# Altium schematic sheet channels_0.schdoc
size 400 x 299 mm; Device: default420x319; Symbol: default420x319; Name: default420x319; Size: "User"; Id: /; File: channels_0; Sheet: /
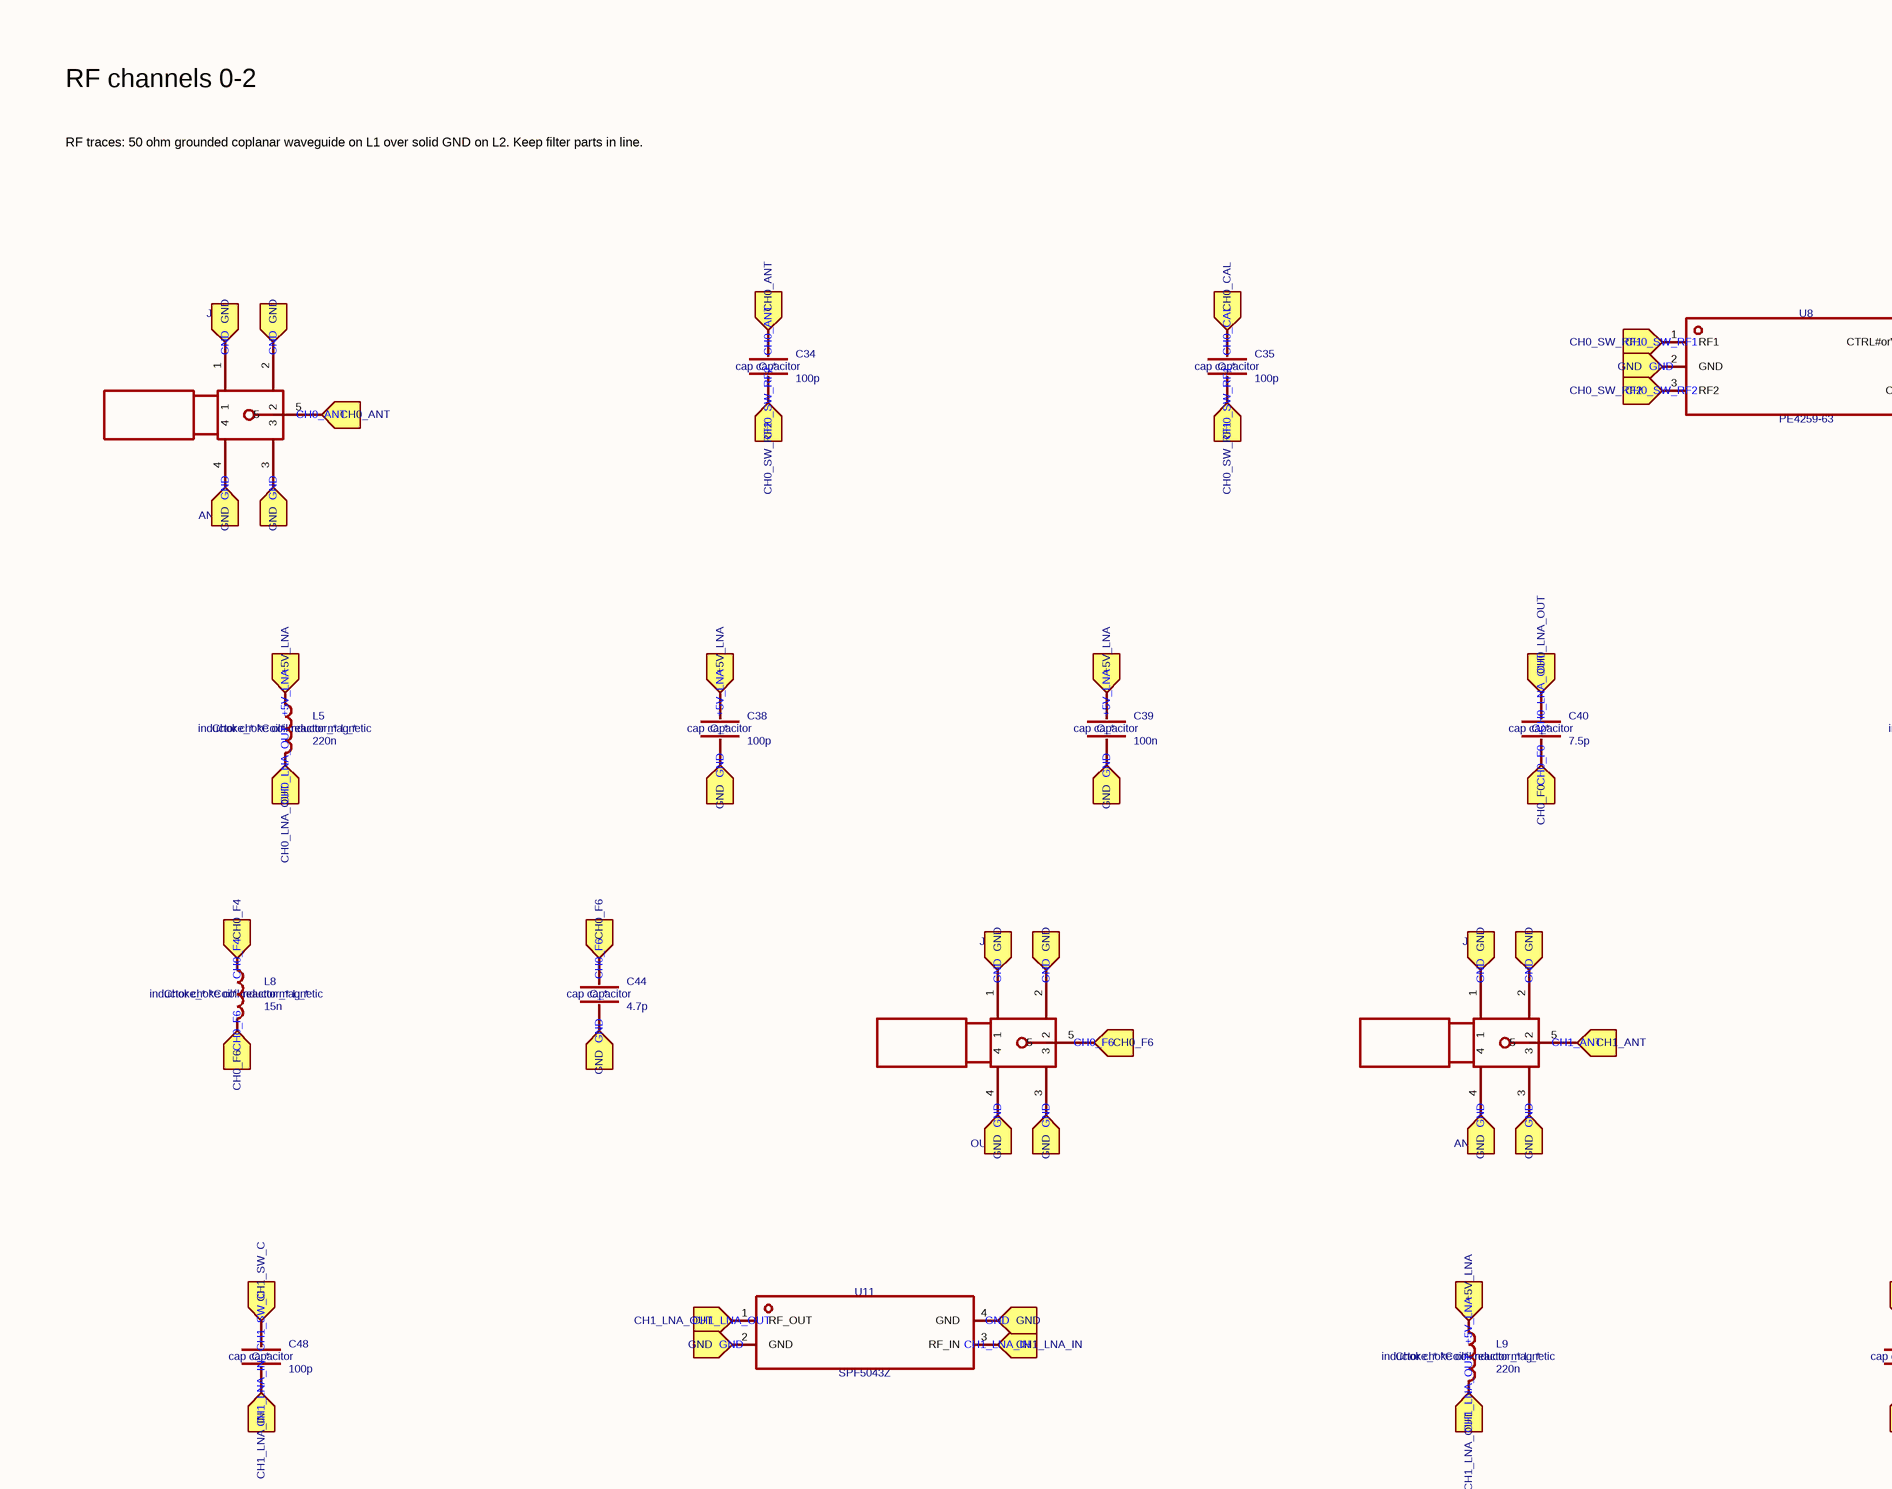
[diagram p0: channels_0.schdoc, top left]
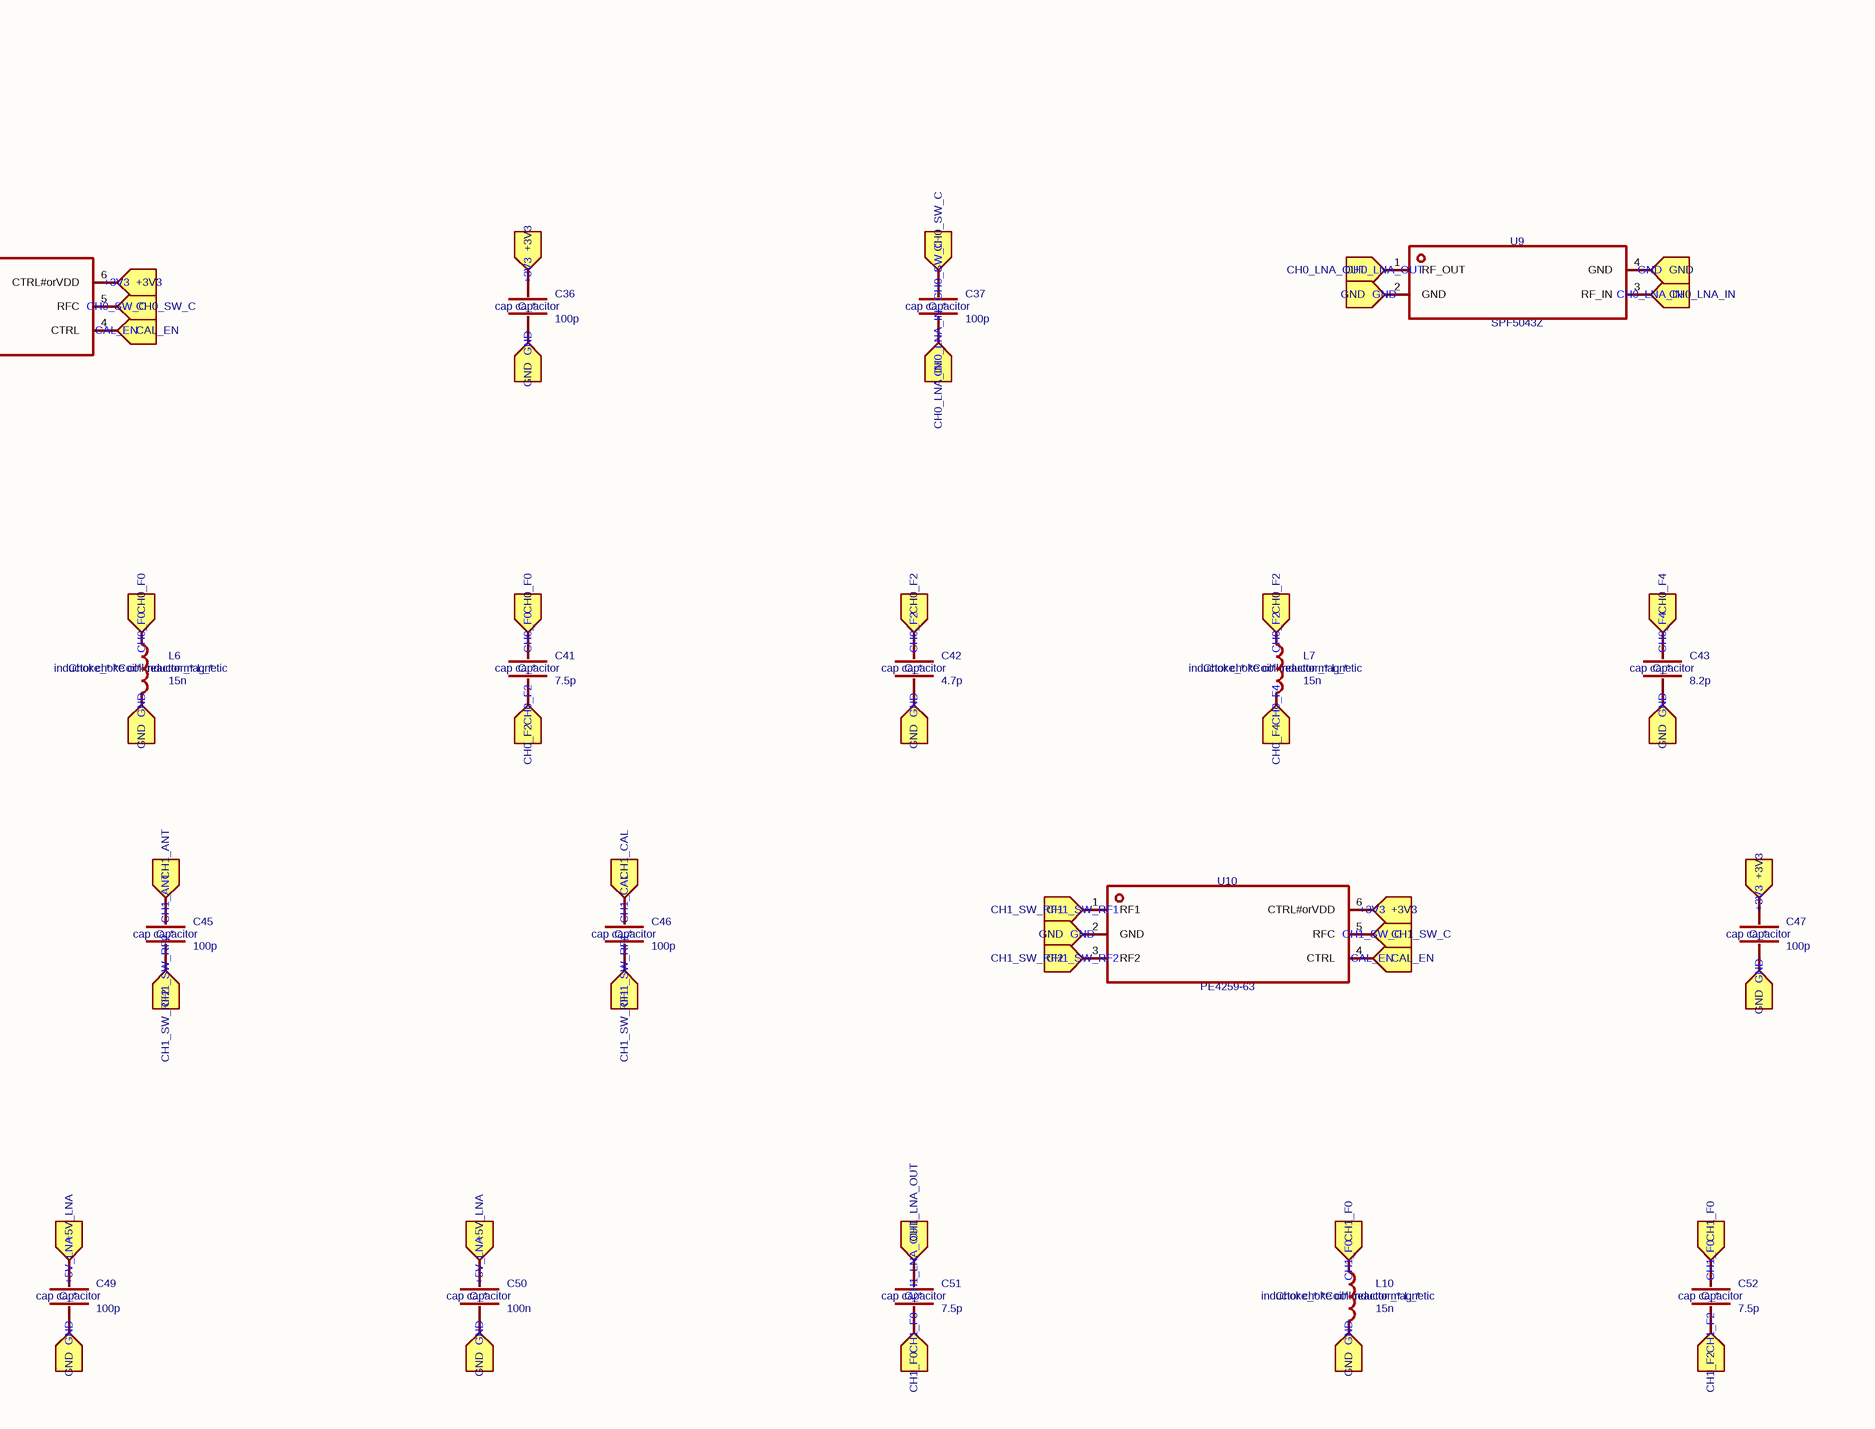
[diagram p1: channels_0.schdoc, top right]
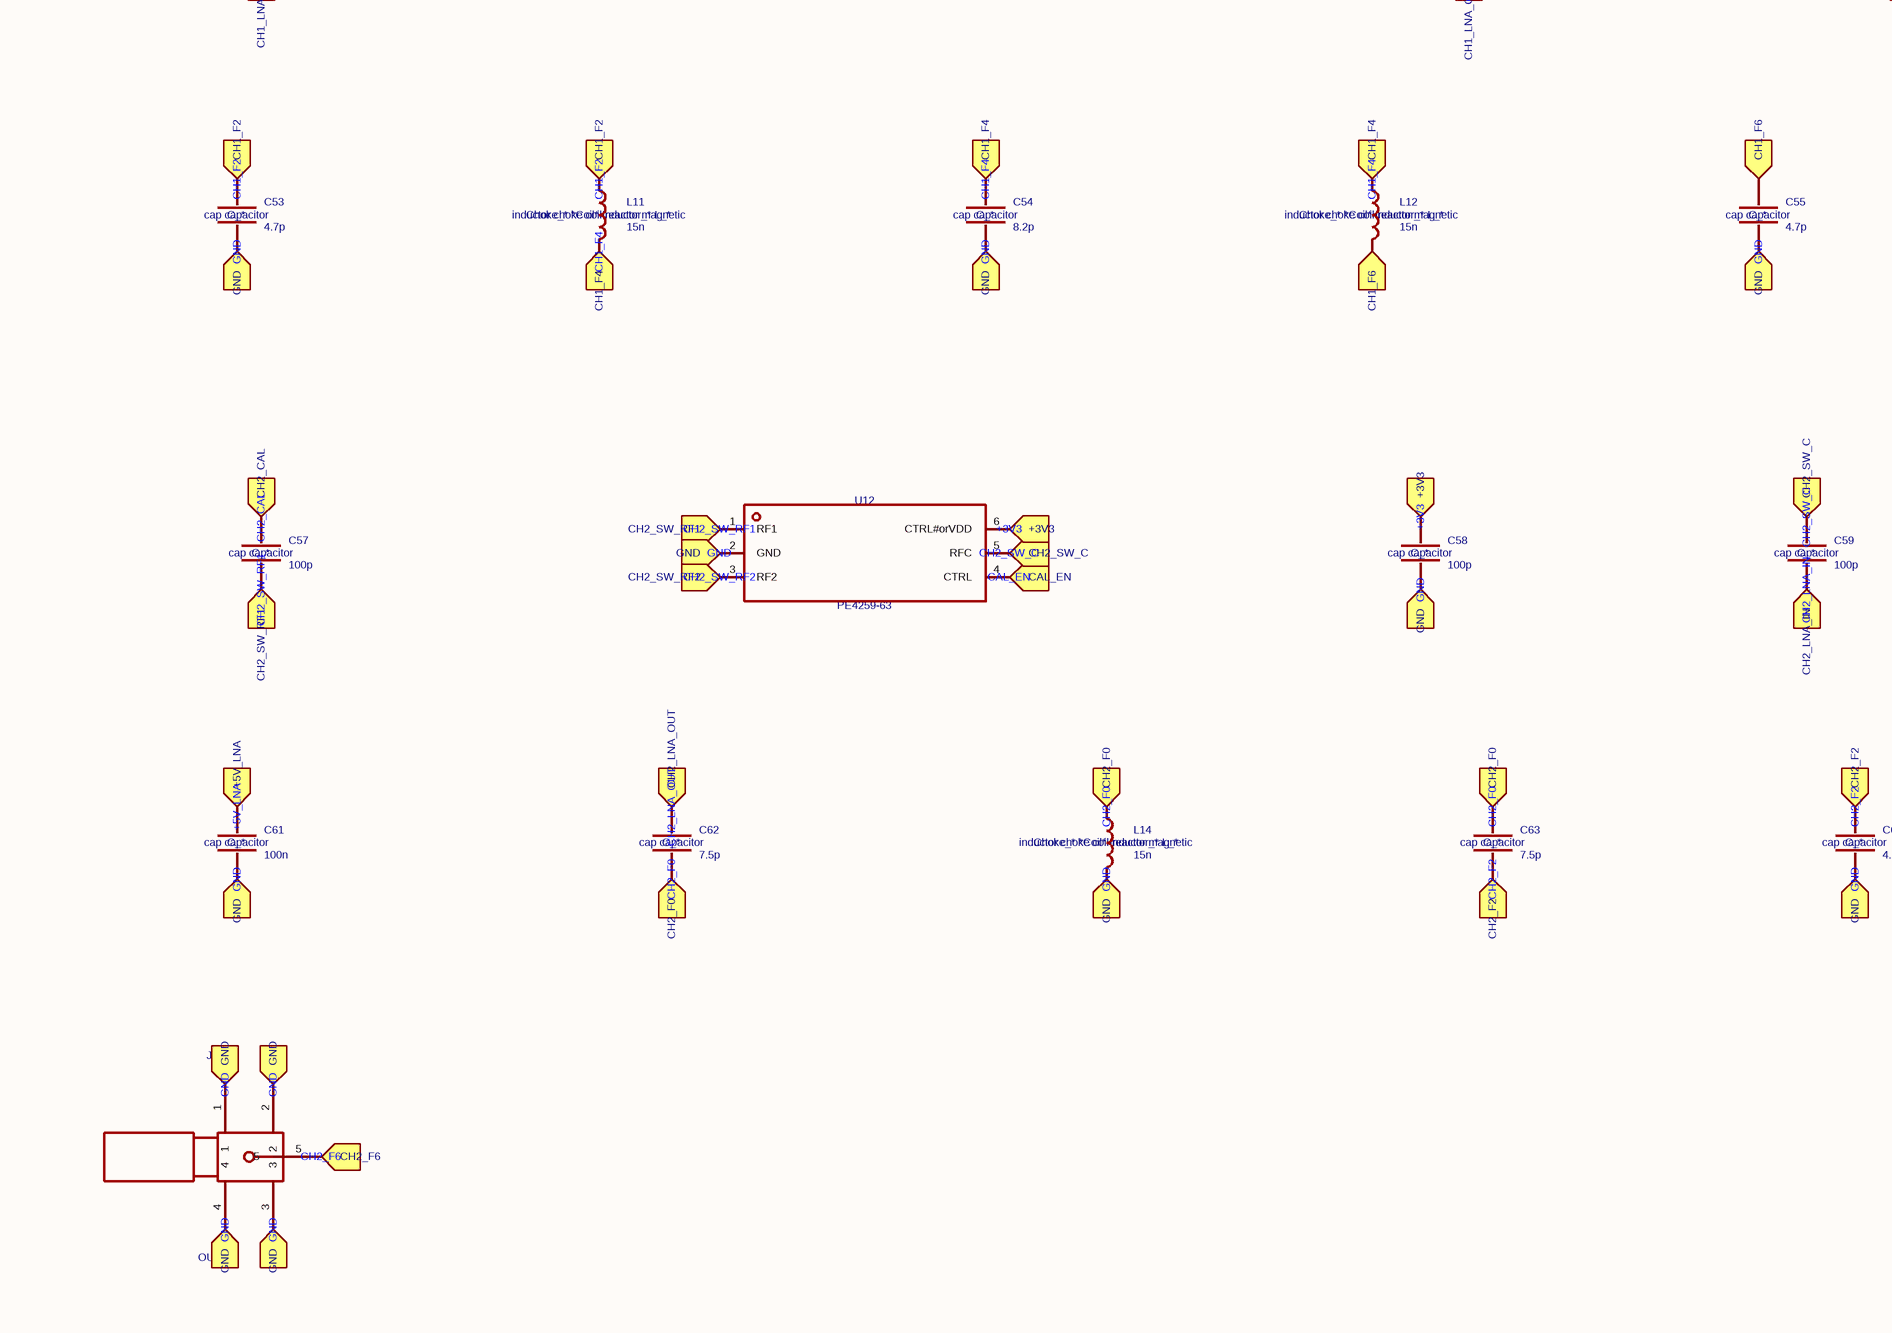
[diagram p2: channels_0.schdoc, bottom left]
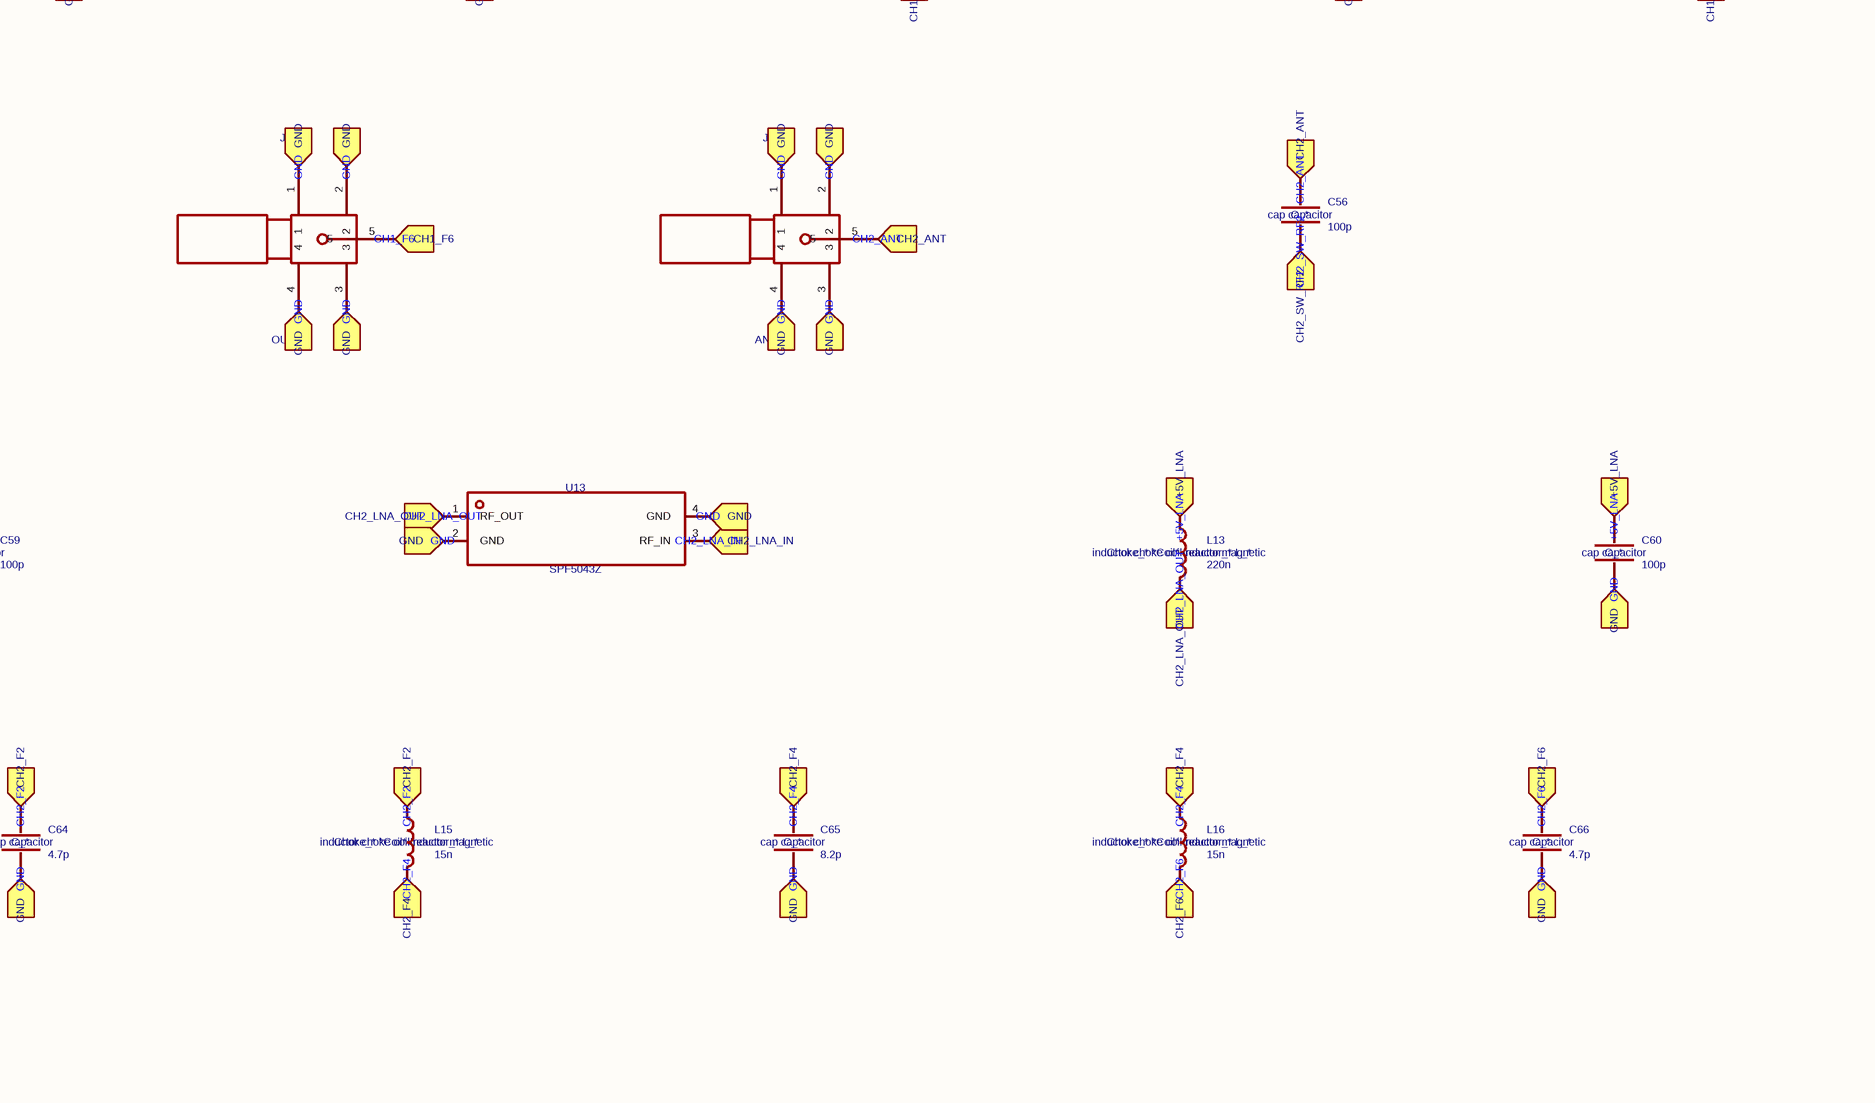
[diagram p3: channels_0.schdoc, bottom right]

## Parts
C34  value 100p  ki_keywords: cap capacitor  ki_fp_filters: C_*  [Capacitor_SMD:C_0402_1005Metric]  (hidden comment: Device_C)
C35  value 100p  ki_keywords: cap capacitor  ki_fp_filters: C_*  [Capacitor_SMD:C_0402_1005Metric]  (hidden comment: Device_C)
C36  value 100p  ki_keywords: cap capacitor  ki_fp_filters: C_*  [Capacitor_SMD:C_0402_1005Metric]  (hidden comment: Device_C)
C37  value 100p  ki_keywords: cap capacitor  ki_fp_filters: C_*  [Capacitor_SMD:C_0402_1005Metric]  (hidden comment: Device_C)
C38  value 100p  ki_keywords: cap capacitor  ki_fp_filters: C_*  [Capacitor_SMD:C_0402_1005Metric]  (hidden comment: Device_C)
C39  value 100n  ki_keywords: cap capacitor  ki_fp_filters: C_*  [Capacitor_SMD:C_0402_1005Metric]  (hidden comment: Device_C)
C40  value 7.5p  ki_keywords: cap capacitor  ki_fp_filters: C_*  [Capacitor_SMD:C_0402_1005Metric]  (hidden comment: Device_C)
C41  value 7.5p  ki_keywords: cap capacitor  ki_fp_filters: C_*  [Capacitor_SMD:C_0402_1005Metric]  (hidden comment: Device_C)
C42  value 4.7p  ki_keywords: cap capacitor  ki_fp_filters: C_*  [Capacitor_SMD:C_0402_1005Metric]  (hidden comment: Device_C)
C43  value 8.2p  ki_keywords: cap capacitor  ki_fp_filters: C_*  [Capacitor_SMD:C_0402_1005Metric]  (hidden comment: Device_C)
C44  value 4.7p  ki_keywords: cap capacitor  ki_fp_filters: C_*  [Capacitor_SMD:C_0402_1005Metric]  (hidden comment: Device_C)
C45  value 100p  ki_keywords: cap capacitor  ki_fp_filters: C_*  [Capacitor_SMD:C_0402_1005Metric]  (hidden comment: Device_C)
C46  value 100p  ki_keywords: cap capacitor  ki_fp_filters: C_*  [Capacitor_SMD:C_0402_1005Metric]  (hidden comment: Device_C)
C47  value 100p  ki_keywords: cap capacitor  ki_fp_filters: C_*  [Capacitor_SMD:C_0402_1005Metric]  (hidden comment: Device_C)
C48  value 100p  ki_keywords: cap capacitor  ki_fp_filters: C_*  [Capacitor_SMD:C_0402_1005Metric]  (hidden comment: Device_C)
C49  value 100p  ki_keywords: cap capacitor  ki_fp_filters: C_*  [Capacitor_SMD:C_0402_1005Metric]  (hidden comment: Device_C)
C50  value 100n  ki_keywords: cap capacitor  ki_fp_filters: C_*  [Capacitor_SMD:C_0402_1005Metric]  (hidden comment: Device_C)
C51  value 7.5p  ki_keywords: cap capacitor  ki_fp_filters: C_*  [Capacitor_SMD:C_0402_1005Metric]  (hidden comment: Device_C)
C52  value 7.5p  ki_keywords: cap capacitor  ki_fp_filters: C_*  [Capacitor_SMD:C_0402_1005Metric]  (hidden comment: Device_C)
C53  value 4.7p  ki_keywords: cap capacitor  ki_fp_filters: C_*  [Capacitor_SMD:C_0402_1005Metric]  (hidden comment: Device_C)
C54  value 8.2p  ki_keywords: cap capacitor  ki_fp_filters: C_*  [Capacitor_SMD:C_0402_1005Metric]  (hidden comment: Device_C)
C55  value 4.7p  ki_keywords: cap capacitor  ki_fp_filters: C_*  [Capacitor_SMD:C_0402_1005Metric]  (hidden comment: Device_C)
C56  value 100p  ki_keywords: cap capacitor  ki_fp_filters: C_*  [Capacitor_SMD:C_0402_1005Metric]  (hidden comment: Device_C)
C57  value 100p  ki_keywords: cap capacitor  ki_fp_filters: C_*  [Capacitor_SMD:C_0402_1005Metric]  (hidden comment: Device_C)
C58  value 100p  ki_keywords: cap capacitor  ki_fp_filters: C_*  [Capacitor_SMD:C_0402_1005Metric]  (hidden comment: Device_C)
C59  value 100p  ki_keywords: cap capacitor  ki_fp_filters: C_*  [Capacitor_SMD:C_0402_1005Metric]  (hidden comment: Device_C)
C60  value 100p  ki_keywords: cap capacitor  ki_fp_filters: C_*  [Capacitor_SMD:C_0402_1005Metric]  (hidden comment: Device_C)
C61  value 100n  ki_keywords: cap capacitor  ki_fp_filters: C_*  [Capacitor_SMD:C_0402_1005Metric]  (hidden comment: Device_C)
C62  value 7.5p  ki_keywords: cap capacitor  ki_fp_filters: C_*  [Capacitor_SMD:C_0402_1005Metric]  (hidden comment: Device_C)
C63  value 7.5p  ki_keywords: cap capacitor  ki_fp_filters: C_*  [Capacitor_SMD:C_0402_1005Metric]  (hidden comment: Device_C)
C64  value 4.7p  ki_keywords: cap capacitor  ki_fp_filters: C_*  [Capacitor_SMD:C_0402_1005Metric]  (hidden comment: Device_C)
C65  value 8.2p  ki_keywords: cap capacitor  ki_fp_filters: C_*  [Capacitor_SMD:C_0402_1005Metric]  (hidden comment: Device_C)
C66  value 4.7p  ki_keywords: cap capacitor  ki_fp_filters: C_*  [Capacitor_SMD:C_0402_1005Metric]  (hidden comment: Device_C)
J3  value ANT0  [prc:SMA-TH_BWSMA-KE-Z001]  (hidden comment: prc_BWSMA-KE-Z001)
J4  value OUT0  [prc:SMA-TH_BWSMA-KE-Z001]  (hidden comment: prc_BWSMA-KE-Z001)
J5  value ANT1  [prc:SMA-TH_BWSMA-KE-Z001]  (hidden comment: prc_BWSMA-KE-Z001)
J6  value OUT1  [prc:SMA-TH_BWSMA-KE-Z001]  (hidden comment: prc_BWSMA-KE-Z001)
J7  value ANT2  [prc:SMA-TH_BWSMA-KE-Z001]  (hidden comment: prc_BWSMA-KE-Z001)
J8  value OUT2  [prc:SMA-TH_BWSMA-KE-Z001]  (hidden comment: prc_BWSMA-KE-Z001)
L5  value 220n  ki_keywords: inductor choke coil reactor magnetic  ki_fp_filters: Choke_* *Coil* Inductor_* L_*  [Inductor_SMD:L_0603_1608Metric]  (hidden comment: Device_L)
L6  value 15n  ki_keywords: inductor choke coil reactor magnetic  ki_fp_filters: Choke_* *Coil* Inductor_* L_*  [Inductor_SMD:L_0402_1005Metric]  (hidden comment: Device_L)
L7  value 15n  ki_keywords: inductor choke coil reactor magnetic  ki_fp_filters: Choke_* *Coil* Inductor_* L_*  [Inductor_SMD:L_0402_1005Metric]  (hidden comment: Device_L)
L8  value 15n  ki_keywords: inductor choke coil reactor magnetic  ki_fp_filters: Choke_* *Coil* Inductor_* L_*  [Inductor_SMD:L_0402_1005Metric]  (hidden comment: Device_L)
L9  value 220n  ki_keywords: inductor choke coil reactor magnetic  ki_fp_filters: Choke_* *Coil* Inductor_* L_*  [Inductor_SMD:L_0603_1608Metric]  (hidden comment: Device_L)
L10  value 15n  ki_keywords: inductor choke coil reactor magnetic  ki_fp_filters: Choke_* *Coil* Inductor_* L_*  [Inductor_SMD:L_0402_1005Metric]  (hidden comment: Device_L)
L11  value 15n  ki_keywords: inductor choke coil reactor magnetic  ki_fp_filters: Choke_* *Coil* Inductor_* L_*  [Inductor_SMD:L_0402_1005Metric]  (hidden comment: Device_L)
L12  value 15n  ki_keywords: inductor choke coil reactor magnetic  ki_fp_filters: Choke_* *Coil* Inductor_* L_*  [Inductor_SMD:L_0402_1005Metric]  (hidden comment: Device_L)
L13  value 220n  ki_keywords: inductor choke coil reactor magnetic  ki_fp_filters: Choke_* *Coil* Inductor_* L_*  [Inductor_SMD:L_0603_1608Metric]  (hidden comment: Device_L)
L14  value 15n  ki_keywords: inductor choke coil reactor magnetic  ki_fp_filters: Choke_* *Coil* Inductor_* L_*  [Inductor_SMD:L_0402_1005Metric]  (hidden comment: Device_L)
L15  value 15n  ki_keywords: inductor choke coil reactor magnetic  ki_fp_filters: Choke_* *Coil* Inductor_* L_*  [Inductor_SMD:L_0402_1005Metric]  (hidden comment: Device_L)
L16  value 15n  ki_keywords: inductor choke coil reactor magnetic  ki_fp_filters: Choke_* *Coil* Inductor_* L_*  [Inductor_SMD:L_0402_1005Metric]  (hidden comment: Device_L)
U8  value PE4259-63  [prc:SC-70-6_L2.2-W1.3-P0.65-LS2.1-BL]  (hidden comment: prc_PE4259-63)
U9  value SPF5043Z  [prc:SOT343_L2.0-W1.3-P1.30-LS2.1-BL]  (hidden comment: prc_SPF5043Z)
U10  value PE4259-63  [prc:SC-70-6_L2.2-W1.3-P0.65-LS2.1-BL]  (hidden comment: prc_PE4259-63)
U11  value SPF5043Z  [prc:SOT343_L2.0-W1.3-P1.30-LS2.1-BL]  (hidden comment: prc_SPF5043Z)
U12  value PE4259-63  [prc:SC-70-6_L2.2-W1.3-P0.65-LS2.1-BL]  (hidden comment: prc_PE4259-63)
U13  value SPF5043Z  [prc:SOT343_L2.0-W1.3-P1.30-LS2.1-BL]  (hidden comment: prc_SPF5043Z)

## Ports
+3V3 (in), +5V_LNA (in), CAL_EN (in), CH0_ANT (in), CH0_CAL (in), CH0_F0 (in), CH0_F2 (in), CH0_F4 (in), CH0_F6 (in), CH0_LNA_IN (in), CH0_LNA_OUT (in), CH0_SW_C (in), CH0_SW_RF1 (in), CH0_SW_RF2 (in), CH1_ANT (in), CH1_CAL (in), CH1_F0 (in), CH1_F2 (in), CH1_F4 (in), CH1_F6 (in), CH1_LNA_IN (in), CH1_LNA_OUT (in), CH1_SW_C (in), CH1_SW_RF1 (in), CH1_SW_RF2 (in), CH2_ANT (in), CH2_CAL (in), CH2_F0 (in), CH2_F2 (in), CH2_F4 (in), CH2_F6 (in), CH2_LNA_IN (in), CH2_LNA_OUT (in), CH2_SW_C (in), CH2_SW_RF1 (in), CH2_SW_RF2 (in), GND (in)

## Nets
+3V3: C36.1 C47.1 C58.1 U8.6(CTRL#orVDD) U10.6(CTRL#orVDD) U12.6(CTRL#orVDD) ; port +3V3
+5V_LNA: C38.1 C39.1 C49.1 C50.1 C60.1 C61.1 L5.1 L9.1 L13.1 ; port +5V_LNA
CAL_EN: U8.4(CTRL) U10.4(CTRL) U12.4(CTRL) ; port CAL_EN
CH0_ANT: C34.1 J3.5 ; port CH0_ANT
CH0_CAL: C35.1 ; port CH0_CAL
CH0_F0: C40.2 C41.1 L6.1 ; port CH0_F0
CH0_F2: C41.2 C42.1 L7.1 ; port CH0_F2
CH0_F4: C43.1 L7.2 L8.1 ; port CH0_F4
CH0_F6: C44.1 J4.5 L8.2 ; port CH0_F6
CH0_LNA_IN: C37.2 U9.3(RF_IN) ; port CH0_LNA_IN
CH0_LNA_OUT: C40.1 L5.2 U9.1(RF_OUT) ; port CH0_LNA_OUT
CH0_SW_C: C37.1 U8.5(RFC) ; port CH0_SW_C
CH0_SW_RF1: C35.2 U8.1(RF1) ; port CH0_SW_RF1
CH0_SW_RF2: C34.2 U8.3(RF2) ; port CH0_SW_RF2
CH1_ANT: C45.1 J5.5 ; port CH1_ANT
CH1_CAL: C46.1 ; port CH1_CAL
CH1_F0: C51.2 C52.1 L10.1 ; port CH1_F0
CH1_F2: C52.2 C53.1 L11.1 ; port CH1_F2
CH1_F4: C54.1 L11.2 L12.1 ; port CH1_F4
CH1_F6: C55.1 J6.5 L12.2 ; port CH1_F6
CH1_LNA_IN: C48.2 U11.3(RF_IN) ; port CH1_LNA_IN
CH1_LNA_OUT: C51.1 L9.2 U11.1(RF_OUT) ; port CH1_LNA_OUT
CH1_SW_C: C48.1 U10.5(RFC) ; port CH1_SW_C
CH1_SW_RF1: C46.2 U10.1(RF1) ; port CH1_SW_RF1
CH1_SW_RF2: C45.2 U10.3(RF2) ; port CH1_SW_RF2
CH2_ANT: C56.1 J7.5 ; port CH2_ANT
CH2_CAL: C57.1 ; port CH2_CAL
CH2_F0: C62.2 C63.1 L14.1 ; port CH2_F0
CH2_F2: C63.2 C64.1 L15.1 ; port CH2_F2
CH2_F4: C65.1 L15.2 L16.1 ; port CH2_F4
CH2_F6: C66.1 J8.5 L16.2 ; port CH2_F6
CH2_LNA_IN: C59.2 U13.3(RF_IN) ; port CH2_LNA_IN
CH2_LNA_OUT: C62.1 L13.2 U13.1(RF_OUT) ; port CH2_LNA_OUT
CH2_SW_C: C59.1 U12.5(RFC) ; port CH2_SW_C
CH2_SW_RF1: C57.2 U12.1(RF1) ; port CH2_SW_RF1
CH2_SW_RF2: C56.2 U12.3(RF2) ; port CH2_SW_RF2
GND: C36.2 C38.2 C39.2 C42.2 C43.2 C44.2 C47.2 C49.2 C50.2 C53.2 C54.2 C55.2 C58.2 C60.2 C61.2 C64.2 C65.2 C66.2 J3.1 J3.2 J3.3 J3.4 J4.1 J4.2 J4.3 J4.4 J5.1 J5.2 J5.3 J5.4 J6.1 J6.2 J6.3 J6.4 J7.1 J7.2 J7.3 J7.4 J8.1 J8.2 J8.3 J8.4 L6.2 L10.2 L14.2 U8.2(GND) U9.2(GND) U9.4(GND) U10.2(GND) U11.2(GND) U11.4(GND) U12.2(GND) U13.2(GND) U13.4(GND) ; port GND

## Notes on the sheet
- RF channels 0-2
- RF traces: 50 ohm grounded coplanar waveguide on L1 over solid GND on L2. Keep filter parts in line.
- 1
- 2
- 3
- 4
- 5
- 6
- 7
- 8
- A
- B
- C
- D
- E
- F
- Size:"User"
- Title:
- File:channels_0
- Sheet:/
- Date:
- Rev:
- Id:/

## Library data of the parts
C34 = Device_C: UniqueId: 553def7d7947fca6; KiLib_Generator: SMD_2terminal_chip_molded; AddInBom: yes; Device: Device_C; Symbol: Device_C; FootprintName: Capacitor_SMD:C_0402_1005Metric
C35 = Device_C: UniqueId: 2b4e6e580c7acde0; KiLib_Generator: SMD_2terminal_chip_molded; AddInBom: yes; Device: Device_C; Symbol: Device_C; FootprintName: Capacitor_SMD:C_0402_1005Metric
C36 = Device_C: UniqueId: 3db1f6a400993974; KiLib_Generator: SMD_2terminal_chip_molded; AddInBom: yes; Device: Device_C; Symbol: Device_C; FootprintName: Capacitor_SMD:C_0402_1005Metric
C37 = Device_C: UniqueId: ff078052695da6b6; KiLib_Generator: SMD_2terminal_chip_molded; AddInBom: yes; Device: Device_C; Symbol: Device_C; FootprintName: Capacitor_SMD:C_0402_1005Metric
C38 = Device_C: UniqueId: 6827ca7a6bd67e26; KiLib_Generator: SMD_2terminal_chip_molded; AddInBom: yes; Device: Device_C; Symbol: Device_C; FootprintName: Capacitor_SMD:C_0402_1005Metric
C39 = Device_C: UniqueId: 54d3d224326b3f8f; KiLib_Generator: SMD_2terminal_chip_molded; AddInBom: yes; Device: Device_C; Symbol: Device_C; LCSC: C1525; FootprintName: Capacitor_SMD:C_0402_1005Metric
C40 = Device_C: UniqueId: 12af2948e5a85261; KiLib_Generator: SMD_2terminal_chip_molded; AddInBom: yes; Device: Device_C; Symbol: Device_C; FootprintName: Capacitor_SMD:C_0402_1005Metric
C41 = Device_C: UniqueId: c9655d0faea7d93e; KiLib_Generator: SMD_2terminal_chip_molded; AddInBom: yes; Device: Device_C; Symbol: Device_C; FootprintName: Capacitor_SMD:C_0402_1005Metric
C42 = Device_C: UniqueId: d39ee3bf0fadc3c1; KiLib_Generator: SMD_2terminal_chip_molded; AddInBom: yes; Device: Device_C; Symbol: Device_C; FootprintName: Capacitor_SMD:C_0402_1005Metric
C43 = Device_C: UniqueId: ad7e9e1612356ddb; KiLib_Generator: SMD_2terminal_chip_molded; AddInBom: yes; Device: Device_C; Symbol: Device_C; FootprintName: Capacitor_SMD:C_0402_1005Metric
C44 = Device_C: UniqueId: 49133e3f49d3504d; KiLib_Generator: SMD_2terminal_chip_molded; AddInBom: yes; Device: Device_C; Symbol: Device_C; FootprintName: Capacitor_SMD:C_0402_1005Metric
C45 = Device_C: UniqueId: 9dabde1b2911a551; KiLib_Generator: SMD_2terminal_chip_molded; AddInBom: yes; Device: Device_C; Symbol: Device_C; FootprintName: Capacitor_SMD:C_0402_1005Metric
C46 = Device_C: UniqueId: df918f74c5ced612; KiLib_Generator: SMD_2terminal_chip_molded; AddInBom: yes; Device: Device_C; Symbol: Device_C; FootprintName: Capacitor_SMD:C_0402_1005Metric
C47 = Device_C: UniqueId: 64621f1995cfd5bc; KiLib_Generator: SMD_2terminal_chip_molded; AddInBom: yes; Device: Device_C; Symbol: Device_C; FootprintName: Capacitor_SMD:C_0402_1005Metric
C48 = Device_C: UniqueId: 808ebf677d8d6d64; KiLib_Generator: SMD_2terminal_chip_molded; AddInBom: yes; Device: Device_C; Symbol: Device_C; FootprintName: Capacitor_SMD:C_0402_1005Metric
C49 = Device_C: UniqueId: 91fd74edebd22ea1; KiLib_Generator: SMD_2terminal_chip_molded; AddInBom: yes; Device: Device_C; Symbol: Device_C; FootprintName: Capacitor_SMD:C_0402_1005Metric
C50 = Device_C: UniqueId: 32f6df7045cd6eaa; KiLib_Generator: SMD_2terminal_chip_molded; AddInBom: yes; Device: Device_C; Symbol: Device_C; LCSC: C1525; FootprintName: Capacitor_SMD:C_0402_1005Metric
C51 = Device_C: UniqueId: d35436b77a732af0; KiLib_Generator: SMD_2terminal_chip_molded; AddInBom: yes; Device: Device_C; Symbol: Device_C; FootprintName: Capacitor_SMD:C_0402_1005Metric
C52 = Device_C: UniqueId: 35d858017be1d91e; KiLib_Generator: SMD_2terminal_chip_molded; AddInBom: yes; Device: Device_C; Symbol: Device_C; FootprintName: Capacitor_SMD:C_0402_1005Metric
C53 = Device_C: UniqueId: af7046427a4bfdfb; KiLib_Generator: SMD_2terminal_chip_molded; AddInBom: yes; Device: Device_C; Symbol: Device_C; FootprintName: Capacitor_SMD:C_0402_1005Metric
C54 = Device_C: UniqueId: 65328433fb04ddb7; KiLib_Generator: SMD_2terminal_chip_molded; AddInBom: yes; Device: Device_C; Symbol: Device_C; FootprintName: Capacitor_SMD:C_0402_1005Metric
C55 = Device_C: UniqueId: 82ba1af55b3917e5; KiLib_Generator: SMD_2terminal_chip_molded; AddInBom: yes; Device: Device_C; Symbol: Device_C; FootprintName: Capacitor_SMD:C_0402_1005Metric
C56 = Device_C: UniqueId: a22d741cda083e99; KiLib_Generator: SMD_2terminal_chip_molded; AddInBom: yes; Device: Device_C; Symbol: Device_C; FootprintName: Capacitor_SMD:C_0402_1005Metric
C57 = Device_C: UniqueId: 21dd5459dde3f81c; KiLib_Generator: SMD_2terminal_chip_molded; AddInBom: yes; Device: Device_C; Symbol: Device_C; FootprintName: Capacitor_SMD:C_0402_1005Metric
C58 = Device_C: UniqueId: 6c1fb86984bf7302; KiLib_Generator: SMD_2terminal_chip_molded; AddInBom: yes; Device: Device_C; Symbol: Device_C; FootprintName: Capacitor_SMD:C_0402_1005Metric
C59 = Device_C: UniqueId: 9b91e7356bb9865f; KiLib_Generator: SMD_2terminal_chip_molded; AddInBom: yes; Device: Device_C; Symbol: Device_C; FootprintName: Capacitor_SMD:C_0402_1005Metric
C60 = Device_C: UniqueId: 769677d4f8f56233; KiLib_Generator: SMD_2terminal_chip_molded; AddInBom: yes; Device: Device_C; Symbol: Device_C; FootprintName: Capacitor_SMD:C_0402_1005Metric
C61 = Device_C: UniqueId: 3745dda5a27601a3; KiLib_Generator: SMD_2terminal_chip_molded; AddInBom: yes; Device: Device_C; Symbol: Device_C; LCSC: C1525; FootprintName: Capacitor_SMD:C_0402_1005Metric
C62 = Device_C: UniqueId: 4b556904310d1556; KiLib_Generator: SMD_2terminal_chip_molded; AddInBom: yes; Device: Device_C; Symbol: Device_C; FootprintName: Capacitor_SMD:C_0402_1005Metric
C63 = Device_C: UniqueId: b3cb865a57c4a975; KiLib_Generator: SMD_2terminal_chip_molded; AddInBom: yes; Device: Device_C; Symbol: Device_C; FootprintName: Capacitor_SMD:C_0402_1005Metric
C64 = Device_C: UniqueId: 9944326385f1aa7b; KiLib_Generator: SMD_2terminal_chip_molded; AddInBom: yes; Device: Device_C; Symbol: Device_C; FootprintName: Capacitor_SMD:C_0402_1005Metric
C65 = Device_C: UniqueId: ac9f836745bfd3f0; KiLib_Generator: SMD_2terminal_chip_molded; AddInBom: yes; Device: Device_C; Symbol: Device_C; FootprintName: Capacitor_SMD:C_0402_1005Metric
C66 = Device_C: UniqueId: fb27f7370dbf7a2e; KiLib_Generator: SMD_2terminal_chip_molded; AddInBom: yes; Device: Device_C; Symbol: Device_C; FootprintName: Capacitor_SMD:C_0402_1005Metric
J3 = prc_BWSMA-KE-Z001: Manufacturer: BAT WIRELESS(蝙蝠无线); ki_keywords: RF Connectors / Coaxial Connectors; UniqueId: bd3ee0abdb58119f; AddInBom: yes; Device: prc_BWSMA-KE-Z001; Symbol: prc_BWSMA-KE-Z001; UserDocLink: https://lcsc.com/product-detail/New-Arrivals_BAT-WIRELESS-BWSMA-KE-Z001_C496549.html; LCSC: C496549; MPN: BWSMA-KE-Z001; LCSC Part: C496549; FootprintName: prc:SMA-TH_BWSMA-KE-Z001
J4 = prc_BWSMA-KE-Z001: Manufacturer: BAT WIRELESS(蝙蝠无线); ki_keywords: RF Connectors / Coaxial Connectors; UniqueId: 7aadee231938cadd; AddInBom: yes; Device: prc_BWSMA-KE-Z001; Symbol: prc_BWSMA-KE-Z001; UserDocLink: https://lcsc.com/product-detail/New-Arrivals_BAT-WIRELESS-BWSMA-KE-Z001_C496549.html; LCSC: C496549; MPN: BWSMA-KE-Z001; LCSC Part: C496549; FootprintName: prc:SMA-TH_BWSMA-KE-Z001
J5 = prc_BWSMA-KE-Z001: Manufacturer: BAT WIRELESS(蝙蝠无线); ki_keywords: RF Connectors / Coaxial Connectors; UniqueId: 188f82074eb8ca32; AddInBom: yes; Device: prc_BWSMA-KE-Z001; Symbol: prc_BWSMA-KE-Z001; UserDocLink: https://lcsc.com/product-detail/New-Arrivals_BAT-WIRELESS-BWSMA-KE-Z001_C496549.html; LCSC: C496549; MPN: BWSMA-KE-Z001; LCSC Part: C496549; FootprintName: prc:SMA-TH_BWSMA-KE-Z001
J6 = prc_BWSMA-KE-Z001: Manufacturer: BAT WIRELESS(蝙蝠无线); ki_keywords: RF Connectors / Coaxial Connectors; UniqueId: be1703a8306ee88a; AddInBom: yes; Device: prc_BWSMA-KE-Z001; Symbol: prc_BWSMA-KE-Z001; UserDocLink: https://lcsc.com/product-detail/New-Arrivals_BAT-WIRELESS-BWSMA-KE-Z001_C496549.html; LCSC: C496549; MPN: BWSMA-KE-Z001; LCSC Part: C496549; FootprintName: prc:SMA-TH_BWSMA-KE-Z001
J7 = prc_BWSMA-KE-Z001: Manufacturer: BAT WIRELESS(蝙蝠无线); ki_keywords: RF Connectors / Coaxial Connectors; UniqueId: adeb8d5268617f3b; AddInBom: yes; Device: prc_BWSMA-KE-Z001; Symbol: prc_BWSMA-KE-Z001; UserDocLink: https://lcsc.com/product-detail/New-Arrivals_BAT-WIRELESS-BWSMA-KE-Z001_C496549.html; LCSC: C496549; MPN: BWSMA-KE-Z001; LCSC Part: C496549; FootprintName: prc:SMA-TH_BWSMA-KE-Z001
J8 = prc_BWSMA-KE-Z001: Manufacturer: BAT WIRELESS(蝙蝠无线); ki_keywords: RF Connectors / Coaxial Connectors; UniqueId: 5c2e899d33916bcd; AddInBom: yes; Device: prc_BWSMA-KE-Z001; Symbol: prc_BWSMA-KE-Z001; UserDocLink: https://lcsc.com/product-detail/New-Arrivals_BAT-WIRELESS-BWSMA-KE-Z001_C496549.html; LCSC: C496549; MPN: BWSMA-KE-Z001; LCSC Part: C496549; FootprintName: prc:SMA-TH_BWSMA-KE-Z001
L5 = Device_L: UniqueId: a672ad5603fb0b7d; KiLib_Generator: SMD_2terminal_chip_molded; AddInBom: yes; Device: Device_L; Symbol: Device_L; FootprintName: Inductor_SMD:L_0603_1608Metric
L6 = Device_L: UniqueId: 47af25b8573c8ed0; KiLib_Generator: SMD_2terminal_chip_molded; AddInBom: yes; Device: Device_L; Symbol: Device_L; FootprintName: Inductor_SMD:L_0402_1005Metric
L7 = Device_L: UniqueId: 6645345e349bedbf; KiLib_Generator: SMD_2terminal_chip_molded; AddInBom: yes; Device: Device_L; Symbol: Device_L; FootprintName: Inductor_SMD:L_0402_1005Metric
L8 = Device_L: UniqueId: 75e42c17a1aecd44; KiLib_Generator: SMD_2terminal_chip_molded; AddInBom: yes; Device: Device_L; Symbol: Device_L; FootprintName: Inductor_SMD:L_0402_1005Metric
L9 = Device_L: UniqueId: d117b5b224b2d503; KiLib_Generator: SMD_2terminal_chip_molded; AddInBom: yes; Device: Device_L; Symbol: Device_L; FootprintName: Inductor_SMD:L_0603_1608Metric
L10 = Device_L: UniqueId: 0449f3f0b77b5331; KiLib_Generator: SMD_2terminal_chip_molded; AddInBom: yes; Device: Device_L; Symbol: Device_L; FootprintName: Inductor_SMD:L_0402_1005Metric
L11 = Device_L: UniqueId: 0b48be2b02231b9b; KiLib_Generator: SMD_2terminal_chip_molded; AddInBom: yes; Device: Device_L; Symbol: Device_L; FootprintName: Inductor_SMD:L_0402_1005Metric
L12 = Device_L: UniqueId: 17da6896838d082f; KiLib_Generator: SMD_2terminal_chip_molded; AddInBom: yes; Device: Device_L; Symbol: Device_L; FootprintName: Inductor_SMD:L_0402_1005Metric
L13 = Device_L: UniqueId: 4c6c9a142d4a9dea; KiLib_Generator: SMD_2terminal_chip_molded; AddInBom: yes; Device: Device_L; Symbol: Device_L; FootprintName: Inductor_SMD:L_0603_1608Metric
L14 = Device_L: UniqueId: 98f88dbce3f84684; KiLib_Generator: SMD_2terminal_chip_molded; AddInBom: yes; Device: Device_L; Symbol: Device_L; FootprintName: Inductor_SMD:L_0402_1005Metric
L15 = Device_L: UniqueId: 6e1bc876f58b9a76; KiLib_Generator: SMD_2terminal_chip_molded; AddInBom: yes; Device: Device_L; Symbol: Device_L; FootprintName: Inductor_SMD:L_0402_1005Metric
L16 = Device_L: UniqueId: c155a61d248d9d24; KiLib_Generator: SMD_2terminal_chip_molded; AddInBom: yes; Device: Device_L; Symbol: Device_L; FootprintName: Inductor_SMD:L_0402_1005Metric
U8 = prc_PE4259-63: Manufacturer: pSemi(游隼半导体); ki_keywords: RF Switches; UniqueId: 484e3008dca2bfa8; AddInBom: yes; Device: prc_PE4259-63; Symbol: prc_PE4259-63; UserDocLink: https://lcsc.com/product-detail/RF-Switches_PS-PE4259-63_C470892.html; LCSC: C470892; MPN: PE4259-63; LCSC Part: C470892; FootprintName: prc:SC-70-6_L2.2-W1.3-P0.65-LS2.1-BL
U9 = prc_SPF5043Z: Manufacturer: Qorvo; ki_keywords: RF Amplifiers; UniqueId: 2dbbb3175ebf36d7; AddInBom: yes; Device: prc_SPF5043Z; Symbol: prc_SPF5043Z; UserDocLink: https://lcsc.com/product-detail/RF-Amplifiers_Qorvo-SPF5043Z_C470902.html; LCSC: C470902; MPN: SPF5043Z; LCSC Part: C470902; FootprintName: prc:SOT343_L2.0-W1.3-P1.30-LS2.1-BL
U10 = prc_PE4259-63: Manufacturer: pSemi(游隼半导体); ki_keywords: RF Switches; UniqueId: c69de7c088414df5; AddInBom: yes; Device: prc_PE4259-63; Symbol: prc_PE4259-63; UserDocLink: https://lcsc.com/product-detail/RF-Switches_PS-PE4259-63_C470892.html; LCSC: C470892; MPN: PE4259-63; LCSC Part: C470892; FootprintName: prc:SC-70-6_L2.2-W1.3-P0.65-LS2.1-BL
U11 = prc_SPF5043Z: Manufacturer: Qorvo; ki_keywords: RF Amplifiers; UniqueId: 2fd166bdb6936536; AddInBom: yes; Device: prc_SPF5043Z; Symbol: prc_SPF5043Z; UserDocLink: https://lcsc.com/product-detail/RF-Amplifiers_Qorvo-SPF5043Z_C470902.html; LCSC: C470902; MPN: SPF5043Z; LCSC Part: C470902; FootprintName: prc:SOT343_L2.0-W1.3-P1.30-LS2.1-BL
U12 = prc_PE4259-63: Manufacturer: pSemi(游隼半导体); ki_keywords: RF Switches; UniqueId: b6112465b0588c80; AddInBom: yes; Device: prc_PE4259-63; Symbol: prc_PE4259-63; UserDocLink: https://lcsc.com/product-detail/RF-Switches_PS-PE4259-63_C470892.html; LCSC: C470892; MPN: PE4259-63; LCSC Part: C470892; FootprintName: prc:SC-70-6_L2.2-W1.3-P0.65-LS2.1-BL
U13 = prc_SPF5043Z: Manufacturer: Qorvo; ki_keywords: RF Amplifiers; UniqueId: 95e557ff5ab9d76b; AddInBom: yes; Device: prc_SPF5043Z; Symbol: prc_SPF5043Z; UserDocLink: https://lcsc.com/product-detail/RF-Amplifiers_Qorvo-SPF5043Z_C470902.html; LCSC: C470902; MPN: SPF5043Z; LCSC Part: C470902; FootprintName: prc:SOT343_L2.0-W1.3-P1.30-LS2.1-BL